# EAGLE design BedroomHubExt (EAGLE 7.7.0)
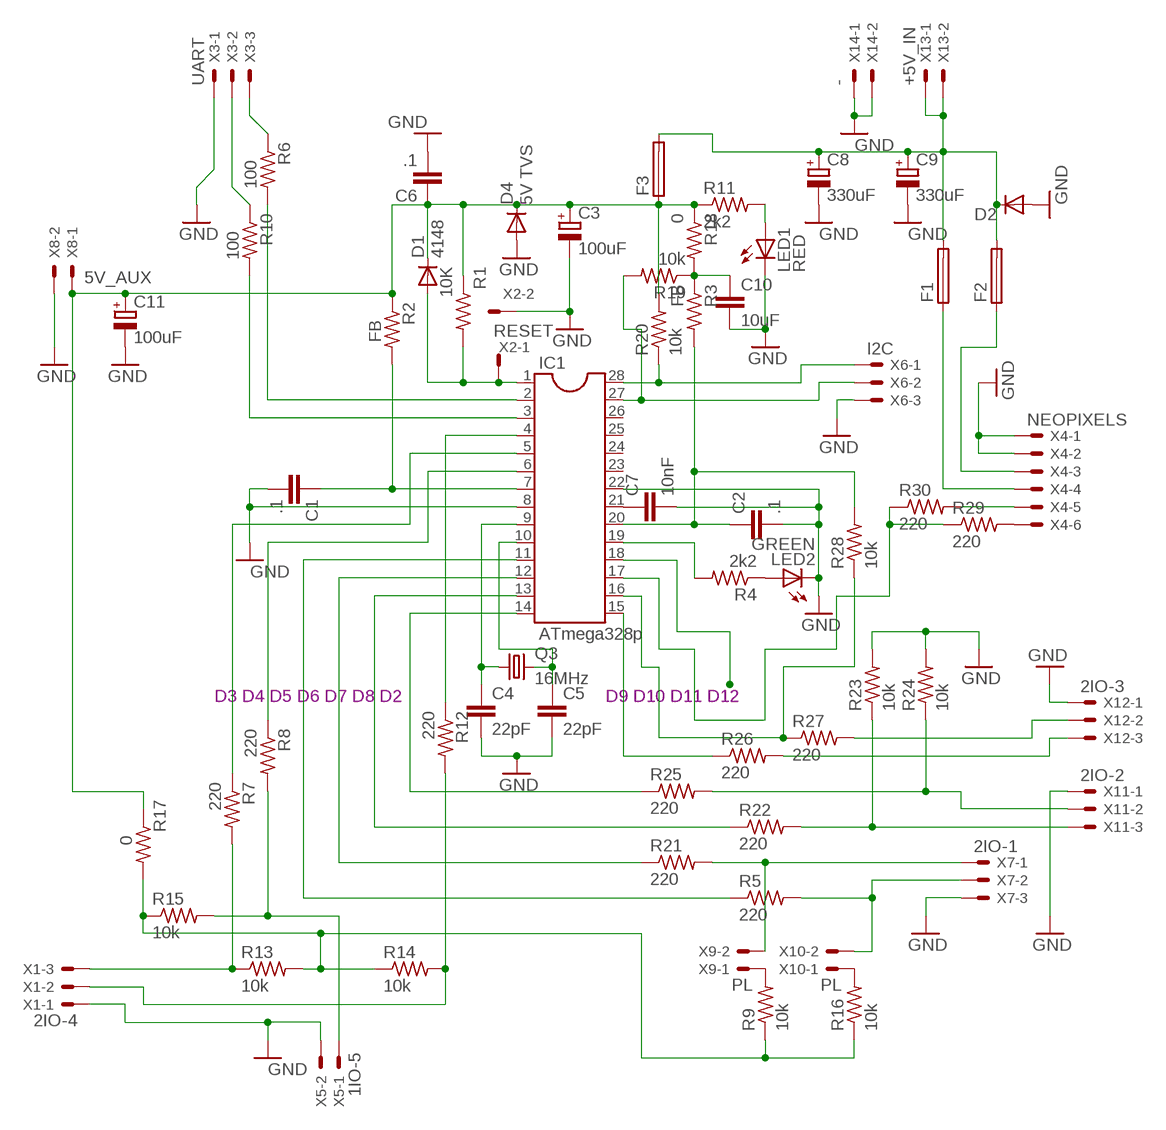
[diagram p0: schematic, sheet 1]

## Parts
C1  .1  C-EUC1210K  [C1210K]
C2  .1  C-EUC1210K  [C1210K]
C3  100uF  CPOL-EUE2.5-7  [E2,5-7]
C4  22pF  C-EUC1210K  [C1210K]
C5  22pF  C-EUC1210K  [C1210K]
C6  .1  C-EUC1210K  [C1210K]
C7  10nF  C-EU050-024X044  [C050-024X044]
C8  330uF  CPOL-EUE5-10.5  [E5-10,5]
C9  330uF  CPOL-EUE5-10.5  [E5-10,5]
C10  10uF  C-EUC1210K  [C1210K]
C11  100uF  CPOL-EUE2.5-7  [E2,5-7]
D1  4148  1N4148DO35-7  [DO35-7]
D2  1N5624  [DO201-15]
D4  5V TVS  AA112  [DO07]
F1  19560  [19560]
F2  19560  [19560]
F3  19560  [19560]
IC1  ATmega328p  DIL28-3  [DIL28-3]
LED1  RED  TLLR4400  [LED3MM]
LED2  GREEN  TLLR4400  [LED3MM]
Q3  16MHz  CRYSTALHC49S  [HC49/S]
R1  10K  R-US_0309/10  [0309/10]
R2  FB  R-US_0309/10  [0309/10]
R3  FB  R-US_0309/10  [0309/10]
R4  2k2  R-US_0309/10  [0309/10]
R5  220  R-US_0207/7  [0207/7]
R6  100  R-US_0309/10  [0309/10]
R7  220  R-US_0309/10  [0309/10]
R8  220  R-US_0309/10  [0309/10]
R9  10k  R-US_R1210  [R1210]
R10  100  R-US_0309/10  [0309/10]
R11  2k2  R-US_0309/10  [0309/10]
R12  220  R-US_0309/10  [0309/10]
R13  10k  R-US_R1210  [R1210]
R14  10k  R-US_R1210  [R1210]
R15  10k  R-US_R1210  [R1210]
R16  10k  R-US_R1210  [R1210]
R17  0  R-US_0309/10  [0309/10]
R18  0  R-US_0309/10  [0309/10]
R19  10k  R-US_R1210  [R1210]
R20  10k  R-US_R1210  [R1210]
R21  220  R-US_0207/7  [0207/7]
R22  220  R-US_0207/7  [0207/7]
R23  10k  R-US_R1210  [R1210]
R24  10k  R-US_R1210  [R1210]
R25  220  R-US_0207/7  [0207/7]
R26  220  R-US_0309/10  [0309/10]
R27  220  R-US_0309/10  [0309/10]
R28  10k  R-US_0309/10  [0309/10]
R29  220  R-US_0309/10  [0309/10]
R30  220  R-US_0309/10  [0309/10]
X1  2IO-4  22-23-2031  [22-23-2031]
X2  RESET  22-23-2021  [22-23-2021]
X3  UART  22-23-2031  [22-23-2031]
X4  NEOPIXELS  22-23-2061  [22-23-2061]
X5  1IO-5  22-23-2021  [22-23-2021]
X6  I2C  22-23-2031  [22-23-2031]
X7  2IO-1  22-23-2031  [22-23-2031]
X8  5V_AUX  22-23-2021  [22-23-2021]
X9  PL  22-23-2021  [22-23-2021]
X10  PL  22-23-2021  [22-23-2021]
X11  2IO-2  22-23-2031  [22-23-2031]
X12  2IO-3  22-23-2031  [22-23-2031]
X13  +5V_IN  22-23-2021  [22-23-2021]
X14  -  22-23-2021  [22-23-2021]

## Nets
GND: C1.2 C2.2 C3.- C4.2 C5.2 C6.2 C7.2 C8.- C9.- C10.2 C11.- D2.A D4.A IC1.8 IC1.22 LED1.K(C) LED2.K(C) R23.2 R24.2 X1.1 X2.2 X3.1 X4.1 X4.2 X5.2 X6.3 X7.3 X8.2 X11.1 X12.1 X14.1 X14.2
N$1: IC1.2 R6.2
N$2: D1.A IC1.1 R1.2 X2.1
N$3: IC1.3 R10.2
N$4: C2.1 IC1.20 R3.2 R28.2
N$5: R24.1 R25.2 X11.2
N$7: R26.2 X12.3
N$8: LED1.A R11.2
N$9: IC1.19 R4.2
N$10: IC1.15 R26.1
N$11: IC1.16 R27.1 R28.1
N$12: IC1.17 R29.1 R30.1
N$13: C4.1 IC1.9 Q3.1
N$14: C5.1 IC1.10 Q3.2
N$15: C7.1 IC1.21
N$16: IC1.18
N$17: LED2.A R4.1
N$18: IC1.14 R25.1
N$19: IC1.13 R22.1
N$20: IC1.12 R21.1
N$21: IC1.11 R5.1
N$22: IC1.6 R8.1
N$24: IC1.5 R7.1
N$25: IC1.4 R12.1
N$26: C3.+ C6.1 C11.+ D1.C D4.C F3.1 R1.1 R2.1 R11.1 R17.1 R18.1 R20.2 X8.1
N$28: R10.1 X3.2
N$29: R7.2 R13.1 X1.3
N$30: R8.2 R15.2 X5.1
N$32: R5.2 X7.2 X10.2
N$33: R21.2 X7.1 X9.2
N$34: R12.2 R14.2 X1.2
N$35: C1.1 IC1.7 R2.2
N$36: R6.1 X3.3
N$37: IC1.28 R20.1 X6.1
N$38: R9.1 R13.2 R14.1 R15.1 R16.1 R17.2
N$39: IC1.27 R19.2 X6.2
N$40: C10.1 R3.1 R18.2 R19.1
N$41: R22.2 R23.1 X11.3
N$42: R9.2 X9.1
N$43: R16.2 X10.1
N$44: R27.2 X12.2
N$45: R29.2 X4.6
N$46: R30.2 X4.5
N$49: F1.1 X4.4
N$50: F2.1 X4.3
N$51: C8.+ C9.+ D2.C F1.2 F2.2 F3.2 X13.1 X13.2
Unconnected: IC1.23 IC1.24 IC1.25 IC1.26

## Notes on the sheet
- D3 D4 D5 D6 D7 D8 D2 | D9 D10 D11 D12

## Library data of the parts
C1 C2 C4-C7 C10 = resistor:C-EU: CAPACITOR, European symbol
C3 C8 C9 C11 = resistor:CPOL-EU: POLARIZED CAPACITOR, European symbol
D1 = diode:1N4148: DIODE high speed (Philips)
D2 = diode:1N5624: DIODE controlled avalanche rectifier
D4 = diode:AA112: DIODE germanium
F1-F3 = fuse:19560: FUSE HOLDER TR5, Wickmann; MPN: 56000001009; OC_FARNELL: 1185363; OC_NEWARK: 15P8392
IC1 = ic-package:DIL28: Dual In Line
LED1 LED2 = led:TLLR4400: Low Current (2mA) LED 3 mm Tinted Diffused Package color RED Source: Data sheet <http://www.farnell.com/datasheets/391100.pdf>; MF: VISHAY SEMICONDUCTOR; OC_FARNELL: 1612437
Q3 = crystal:CRYSTAL: CRYSTAL; OC_FARNELL: 1667008; OC_NEWARK: unknown
R1-R30 = resistor:R-US_: RESISTOR, American symbol
X1 X3 X6 X7 X11 X12 = con-molex:22-23-2031: .100" (2.54mm) Center Header - 3 Pin; MF: MOLEX; MPN: 22-23-2031; OC_FARNELL: 1462950; OC_NEWARK: 30C0862
X2 X5 X8-X10 X13 X14 = con-molex:22-23-2021: .100" (2.54mm) Center Header - 2 Pin; MF: MOLEX; MPN: 22-23-2021; OC_FARNELL: 1462926; OC_NEWARK: 25C3832
X4 = con-molex:22-23-2061: .100" (2.54mm) Center Header - 6 Pin; MF: MOLEX; MPN: 22-23-2061; OC_FARNELL: 1462922; OC_NEWARK: 27C1933

## Board
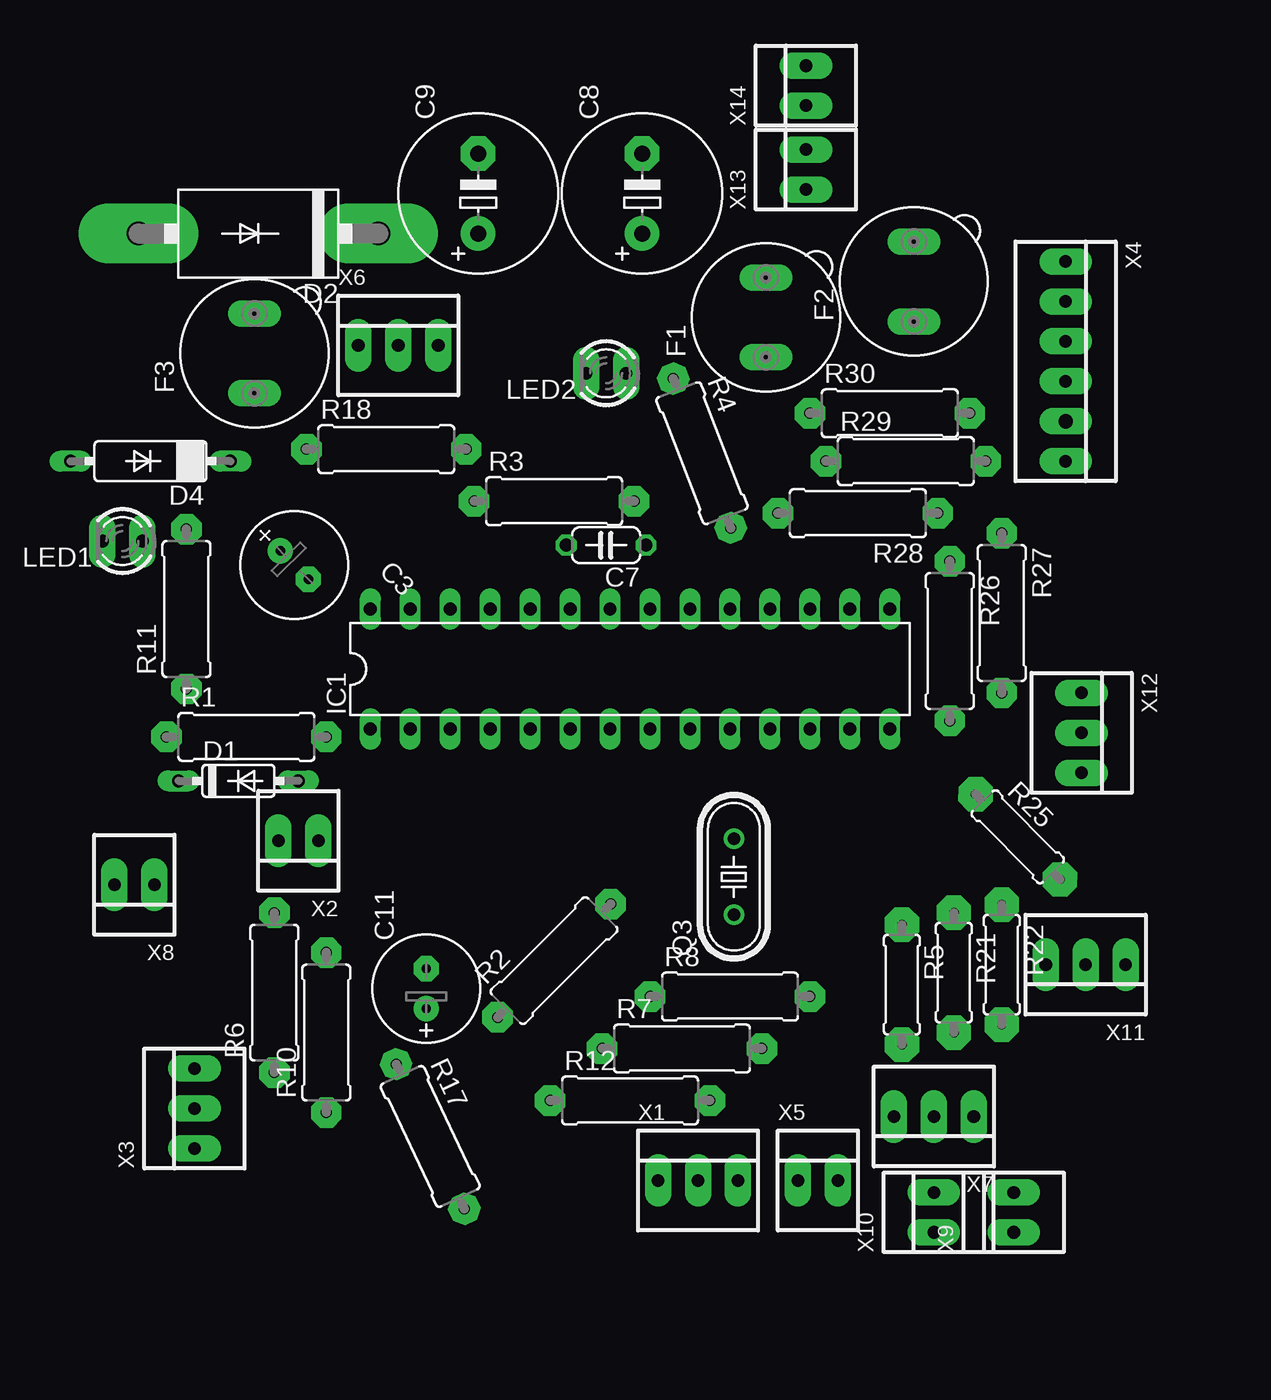
[diagram p1: board, top side]
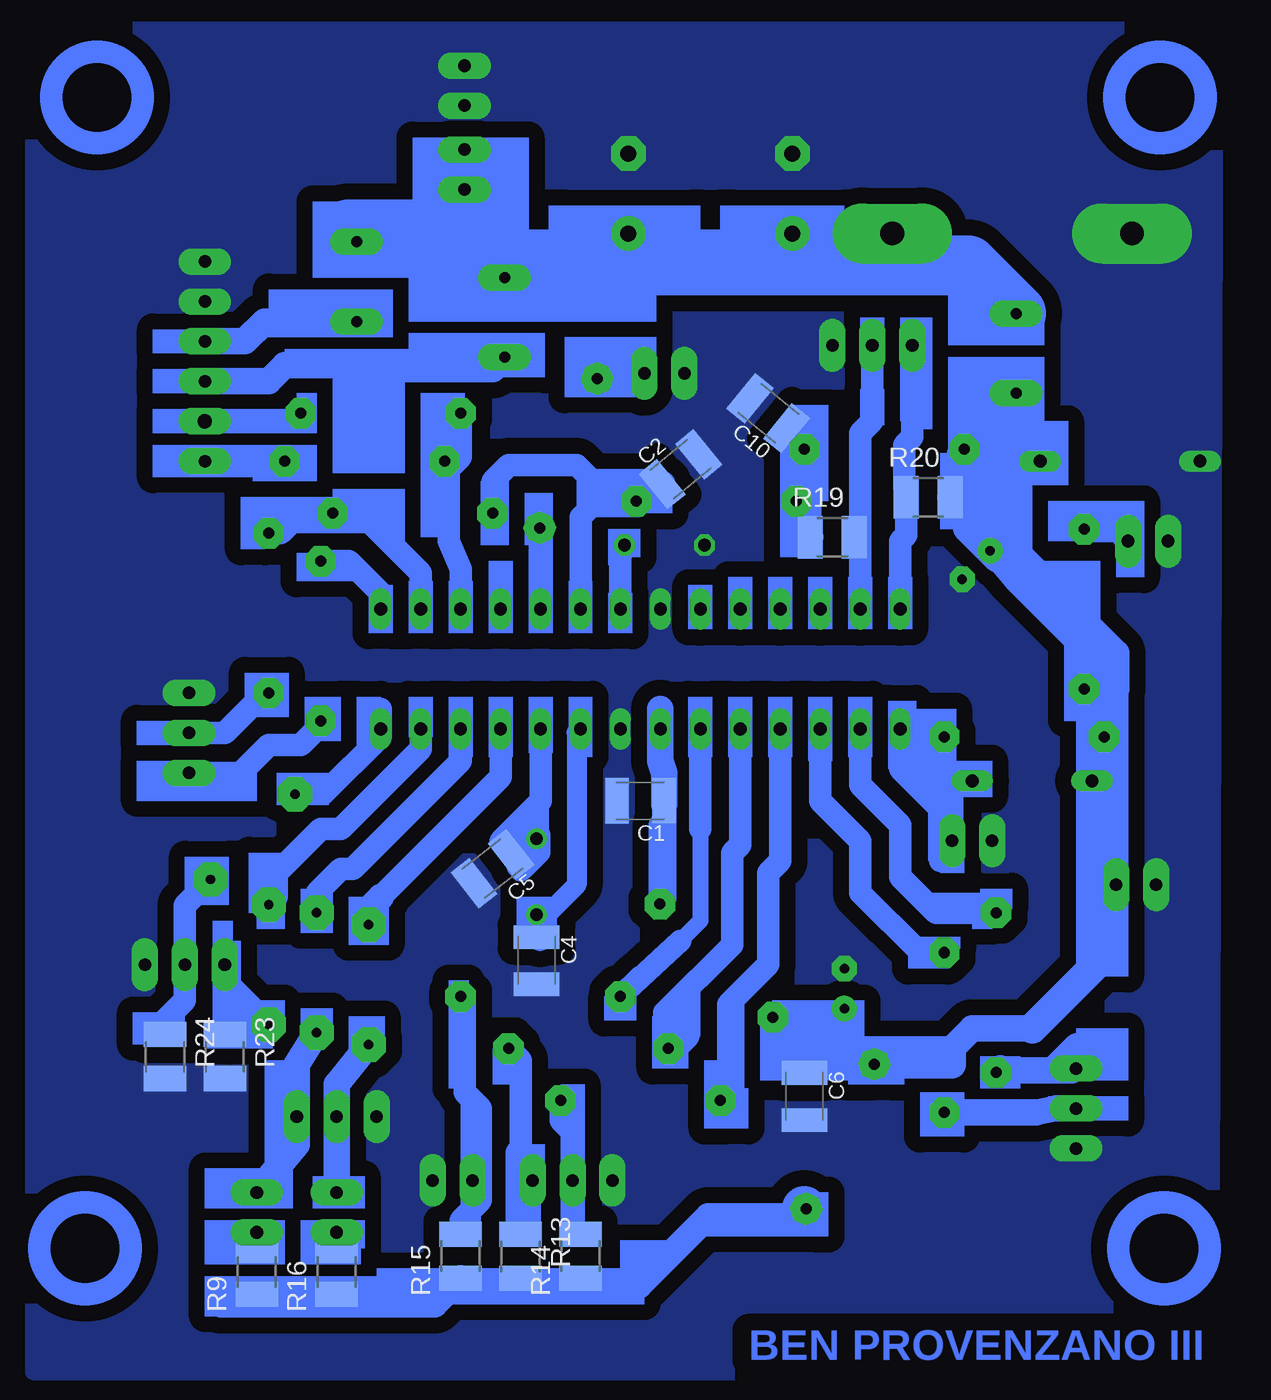
[diagram p2: board, bottom side, seen from below]

No outline drawn. Coordinates in mm, seen from the top.
Copper layers (1*16): Top 0.035mm / dielectric 1.5mm / Bottom 0.035mm
Design rules "default": minimum track width 10mil, minimum drill 24mil, track to track 8mil, track to pad 8mil, pad to pad 8mil, via to via 8mil, smd to smd 8mil, copper to edge 40mil, drill to drill 8mil, minimum pad ring 10mil, minimum via ring 8mil, stop-mask expansion 4mil, vias tented up to drill 0mil, thermal gap 10mil

### Footprints (pad centres in the part's own frame; a part is rotated, then mirrored left to right if it is on the bottom)
C1210K = smd 1.5 x 2.9: 1 -1.5,0; 2 1.5,0
E2,5-7 = drill 0.6 pad 1.6: + -1.27,0 | drill 0.6 pad 1.6 octagon: - 1.27,0
C050-024X044 = drill 0.813 octagon: 1 -2.54,0; 2 2.54,0
E5-10,5 = drill 1.016 pad 2.184: + -2.54,0 | drill 1.016 pad 2.184 octagon: - 2.54,0
DO35-7 = drill 0.813 long: A 3.81,0; C -3.81,0
DO201-15 = drill 1.499 pad 3.81 long: A 7.62,0; C -7.62,0
DO07 = drill 0.813 long: A 5.08,0; C -5.08,0
19560 = drill 0.7 pad 1.676 long: 1 -2.54,0; 2 2.54,0
DIL28-3 = drill 0.813 long: 1 -16.51,-3.81; 2 -13.97,-3.81; 3 -11.43,-3.81; 4 -8.89,-3.81; 5 -6.35,-3.81; 6 -3.81,-3.81; 7 -1.27,-3.81; 8 1.27,-3.81; 9 3.81,-3.81; 10 6.35,-3.81; 11 8.89,-3.81; 12 11.43,-3.81; 13 13.97,-3.81; 14 16.51,-3.81; 15 16.51,3.81; 16 13.97,3.81; 17 11.43,3.81; 18 8.89,3.81; 19 6.35,3.81; 20 3.81,3.81; 21 1.27,3.81; 22 -1.27,3.81; 23 -3.81,3.81; 24 -6.35,3.81; 25 -8.89,3.81; 26 -11.43,3.81; 27 -13.97,3.81; 28 -16.51,3.81
LED3MM = drill 0.813 pad 1.676 long: A -1.27,0; K 1.27,0
HC49/S = drill 0.813: 1 -2.413,0; 2 2.413,0
0309/10 = drill 0.7 pad 1.93 octagon: 1 -5.08,0; 2 5.08,0
0207/7 = drill 0.6 pad 2.184 octagon: 1 -3.81,0; 2 3.81,0
R1210 = smd 1.6 x 2.7: 1 -1.4,0; 2 1.4,0
22-23-2031 = drill 0.8 pad 1.676 long: 1 -2.54,0; 2 0,0; 3 2.54,0
22-23-2021 = drill 0.8 pad 1.676 long: 1 -1.27,0; 2 1.27,0
22-23-2061 = drill 0.8 pad 1.676 long: 1 -6.35,0; 2 -3.81,0; 3 -1.27,0; 4 1.27,0; 6 6.35,0 | drill 0.9 pad 1.676 long: 5 3.81,0

### Placement (x,y rotation side)
C1  56.13,-8.13 180 bottom
C2  53.59,12.95 39.3 bottom
C3  34.8,6.86 314.6 top
C4  62.74,-18.29 270 bottom
C5  65.53,-12.45 217.9 bottom
C6  45.72,-26.92 270 bottom
C7  54.61,8.13 180 top
C8  56.9,30.48 90 top
C9  46.48,30.48 90 top
C10  48.01,16.51 140.9 bottom
C11  43.18,-20.07 90 top
D1  31.24,-6.86 0 top
D2  32.51,27.94 180 top
D4  25.65,13.46 180 top
F1  64.77,22.61 90 top
F2  74.17,24.89 90 top
F3  32.26,20.32 90 top
IC1  56.13,0.25 0 top
LED1  23.88,8.38 180 top
LED2  54.61,19.05 180 top
Q3  62.74,-12.95 90 top
R1  31.75,-4.06 0 top
R2  51.31,-18.29 45 top
R3  51.31,10.92 0 top
R4  60.71,13.97 291 top
R5  73.41,-19.81 270 top
R6  33.53,-20.32 90 top
R7  59.44,-23.88 0 top
R8  62.48,-20.57 0 top
R9  80.52,-38.1 90 bottom
R10  36.83,-22.86 90 top
R11  27.94,4.06 90 top
R12  56.13,-27.18 0 top
R13  63.75,-37.08 270 bottom
R14  59.94,-37.08 90 bottom
R15  67.56,-37.08 90 bottom
R16  75.44,-38.1 90 bottom
R17  43.43,-29.46 295.3 top
R18  40.64,14.22 0 top
R19  43.94,8.64 0 bottom
R20  37.85,11.18 0 bottom
R21  76.71,-19.05 270 top
R22  79.76,-18.54 270 top
R23  82.55,-24.38 270 bottom
R24  86.36,-24.38 270 bottom
R25  80.77,-10.41 314.6 top
R26  76.45,2.03 270 top
R27  79.76,3.81 270 top
R28  70.61,10.16 180 top
R29  73.66,13.46 0 top
R30  72.64,16.51 0 top
X1  60.45,-32.26 0 top
X2  35.05,-10.67 180 top
X3  28.45,-27.69 90 top
X4  83.82,19.81 270 top
X5  68.07,-32.26 0 top
X6  41.4,20.83 0 top
X7  75.44,-28.19 180 top
X8  24.64,-13.46 180 top
X9  80.52,-34.29 90 top
X10  75.44,-34.29 90 top
X11  85.09,-18.54 180 top
X12  84.84,-3.81 270 top
X13  67.31,32 90 top
X14  67.31,37.34 90 top

### Tracks (layer width: path | path; a pad name or v marks a point on that pad's centre or on a via)
GND
  pour Bottom (isolate 1.016, no thermals): 19.56,40.89 94.74,40.89 94.74,-44.45 19.81,-44.45
N$1
  Bottom 1.422: IC1.2 42.16,-7.11 39.62,-9.65 39.62,-12.95 37.34,-15.24 R6.2
N$2
  Bottom 1.422: 36.96,-8.76 36.32,-6.86 | 36.32,-6.86 X2.1 | 37.08,-11.94 37.08,-7.11 36.83,-6.86 | 36.83,-6.86 R1.2 | D1.A 36.32,-6.86 | 36.83,-6.86 36.7,-6.73 36.96,-8.76 | 36.96,-8.76 39.62,-6.1 IC1.1
N$3
  Bottom 1.422: IC1.3 44.7,-8.13 42.16,-10.67 42.16,-13.97 38.35,-17.78 R10.2
N$4
  Bottom 1.422: 57.01,11.06 57.01,11.76 | 59.94,3.3 IC1.20 59.94,9.91 58.67,11.18 58.17,11.12 | 58.17,11.12 R3.2 | 58.17,11.12 58.17,11.18 60.2,13.21 64.52,13.21 65.53,12.19 R28.2
  Bottom 1.676: C2.1 57.01,11.76 R3.2
N$5
  Bottom 1.422: R25.2 85.09,-14.77 X11.2 85.09,-20.83 86.36,-22.1 R24.1
N$6
  Bottom 1.676: 27.18,-3.81 27.18,-3.56
N$7
  Bottom 1.422: X12.3 81.53,-6.35 79.76,-4.57 77.72,-4.57 76.45,-3.3 R26.2
N$8
  Bottom 1.676: LED1.A 25.65,9.14 R11.2
N$9
  Bottom 1.422: IC1.19 R4.2
N$10
  Bottom 1.422: R26.1 74.68,7.11 72.64,5.08 IC1.15
N$11
  Bottom 1.422: IC1.16 70.1,6.35 73.66,9.91 75.69,9.91 | 75.69,9.91 77.98,9.91 78.99,8.89 R27.1 | R28.1 75.69,9.91
N$12
  Bottom 1.422: IC1.17 67.56,6.6 68.33,8.38 68.33,12.95 67.94,13.34 | 67.94,13.34 67.56,13.72 R30.1 | R29.1 68.45,13.34 67.94,13.34
N$13
  Bottom 1.27: IC1.9 60.2,-3.81 60.2,-13.46 62.99,-16.26 C4.1 62.51,-17.04 62.23,-16.76 62.23,-15.88 Q3.1
N$14
  Bottom 1.27: Q3.2 62.48,-10.29 62.48,-11.43 63.5,-12.45 63.75,-12.63 63.94,-12.29 C5.1
  Bottom 1.422: IC1.10 62.48,-8.13 65.02,-10.67 64.35,-11.34 C5.1 | 63.94,-9.59 63.94,-12.28 63.94,-12.29
N$15
  Bottom 1.422: C7.1 57.4,7.37 IC1.21
N$17
  Bottom 1.422: R4.1 58.88,18.84 58.42,19.3 56.39,19.3 LED2.A
N$18
  Bottom 1.422: 72.64,-2.29 IC1.14 72.64,-4.06 76.28,-7.7 R25.1
N$19
  Bottom 1.422: IC1.13 70.1,-4.83 75.18,-9.91 76.45,-9.91 79.25,-12.7 79.25,-14.22 R22.1
N$20
  Bottom 1.422: IC1.12 67.56,-5.59 74.42,-12.45 75.18,-12.45 76.71,-13.97 R21.1
N$21
  Bottom 1.422: IC1.11 65.02,-6.6 72.64,-14.22 | R5.1 | 73.66,-16.26 R5.1 | R5.1 73.42,-14.99
  Bottom 1.676: 72.64,-14.22 73.42,-14.99
N$22
  Bottom 1.016: 52.32,-9.91 52.32,-15.75 53.59,-17.02
  Bottom 1.422: IC1.6 52.32,-9.91 | 53.59,-17.02 R8.1 56.16,-19.33
N$24
  Bottom 1.422: IC1.5 49.78,-10.92 50.29,-11.43 50.29,-17.27 54.61,-21.59 54.61,-22.86 53.09,-21.34 | R7.1 53.85,-23.88 53.09,-23.11 53.09,-21.34 | 53.09,-21.34 53.09,-20.83
N$25
  Bottom 1.422: IC1.4 47.24,-11.94 48.01,-12.7 48.01,-18.54 50.55,-21.08 50.55,-26.42 R12.1 50.55,-27.94
N$26
  Bottom 1.422: 27.43,-11.94 27.43,-8.89 D1.C 26.67,-7.37 R1.1 26.67,0.76 27.2,0.76 32.38,5.94 C3.+ | 30.73,5.59 31.5,6.35 31.77,6.63 32.05,6.74 C3.+ | R2.1 45.47,-24.13 C11.+ 45.21,-24.64 | 45.21,-24.64 R17.1 | 45.21,-24.64 45.72,-25.15 C6.1 | 32.26,6.35 32,6.6 30.99,6.6 33.53,9.14 33.53,16 | 35.56,9.14 34.54,8.13 | 33.53,7.11 33.91,7.49 | 33.91,7.49 34.54,8.13 | 34.54,8.13 34.54,12.95 34.29,13.21 34.29,13.72 | 34.29,13.72 34.29,15.49 R18.1 | C3.+ 33.91,7.49 | 26.16,-13.46 X8.1 | D4.C 32.26,13.72 34.29,13.72
  Bottom 1.676: 27.2,0.76 27.18,0.76 26.92,1.02 26.92,1.78 | 26.16,-13.55 26.16,-13.46 26.16,-8.89 27.43,-8.89 | 35.81,11.68 35.81,9.91 | 32.26,6.35 31.5,6.35 | R11.1 25.91,-1.02 25.91,1.27 31.38,6.74 32.05,6.74 | R18.1 35.81,13.97 35.81,11.68 | R20.2 35.81,11.68 | 36.32,-23.88 35.05,-22.61 31.24,-22.61 | 33.53,16 32.26,17.27 F3.1
  Bottom 1.778: R17.1 39.88,-24.89 36.32,-24.89 36.32,-23.88
  Bottom 1.93: 31.24,-22.61 26.92,-18.29 26.92,-13.21 26.67,-13.46 26.16,-13.46
N$28
  Bottom 1.676: X3.2 29.72,-27.69 30.99,-27.94 R10.1
N$29
  Bottom 1.422: R13.1 64.01,-35.43 64.01,-31.24 | 64.01,-31.24 64.01,-30.48 63.75,-30.23 63.75,-24.64 R7.2 | X1.3 64.01,-31.24
N$30
  Bottom 1.422: R8.2 67.31,-20.83 67.31,-26.67 66.29,-27.69 66.29,-32.26 | 66.29,-32.26 66.29,-33.53 67.56,-34.8 R15.2 | X5.1 66.29,-32.26
N$32
  Bottom 1.676: R5.2 75.44,-26.16 X7.2 X10.2
N$33
  Bottom 1.676: R21.2 77.98,-24.89 X7.1 77.98,-29.97 X9.2
N$34
  Bottom 1.422: R12.2 61.21,-28.45 60.45,-29.21 X1.2 60.45,-35.18 R14.2
N$35
  Bottom 1.422: R2.2 54.9,-9.66 54.61,-9.37 54.61,-7.62 | C1.1 54.61,-8.1 54.61,-7.87
  Bottom 1.676: 54.86,-2.29 IC1.7 54.86,-5.59 54.61,-6.35 54.61,-7.62 54.61,-7.87 54.61,-8.36
N$36
  Bottom 1.422: X3.3 27.94,-24.64 27.94,-23.62 28.45,-23.62 30.23,-25.4 32.51,-25.4 32.26,-25.15 X3.3 | X3.3 28.7,-25.4 R6.1
  Bottom 1.676: 33.27,-25.15 R6.1
N$37
  Bottom 1.422: IC1.28 39.62,8.38 39.25,8.76 R20.1 39.37,11.81 39.37,14.48 38.86,14.99 X6.1
N$38
  Bottom 1.422: R14.1 60.39,-38.93 60.58,-39.12 63.75,-39.12 | 63.75,-39.12 67.31,-39.12 67.31,-38.74 R15.1 | R13.2 63.75,-39.12
  Bottom 1.676: R17.2 46.74,-34.54 51.82,-34.54 56.2,-38.93 60.39,-38.93 | R15.1 69.21,-40.13 82.8,-40.13 82.17,-39.5 R9.1 R16.1
N$39
  Bottom 1.422: 42.16,9.01 IC1.27 | R19.2 42.16,9.01 | X6.2 41.4,16 42.16,15.24 42.16,9.01
N$40
  Bottom 1.422: R18.2 46.84,15.35 C10.1
  Bottom 1.676: R3.1 45.47,10.16 | 45.47,10.16 45.47,9.14 | 45.47,10.16 45.47,14.22 R18.2 46.23,9.52 R19.1
N$41
  Bottom 1.422: R22.2 80.9,-21.21 | 80.9,-21.21 82.55,-19.56 X11.3 | R23.1 80.9,-21.33 80.9,-21.21
N$42
  Bottom 1.676: R9.2 X9.1
N$43
  Bottom 1.676: R16.2 X10.1
N$44
  Bottom 1.422: X12.2 82.55,-3.81 80.01,-1.27 R27.2
N$45
  Bottom 1.422: R29.2 X4.6
N$46
  Bottom 1.422: R30.2 78.23,16 X4.5
N$49
  Bottom 1.676: F1.1 65.53,19.3 71.88,19.3 72.14,19.56 78.74,19.56 79.76,18.54 X4.4
N$50
  Bottom 1.676: F2.1 80.01,22.35 81.28,21.08 X4.3
N$51
  Bottom 1.422: F1.2 64.52,25.4 64.52,25.91 | F2.2 75.44,28.7 75.44,28.96 74.68,28.19 | C9.+ 46.99,27.43 46.99,25.91 | C8.+ 58.93,25.91 59.69,25.91 | D2.C 39.37,27.18 39.37,25.91 | X13.2 X13.1 | 67.31,28.96 X13.1 | X13.1 66.8,30.23 66.8,28.19
  Bottom 3.81: F3.2 35.31,25.91 39.37,25.91 46.99,25.91 59.69,25.91 64.52,25.91 66.8,28.19 74.68,28.19
(copper drawn outside any net)
  shapes: Bottom area x308, Bottom circle x5

### Text on the board
Bottom: BEN PROVENZANO III